# Altium project OFP_MCM_v1.6.3.PrjPcb (part 1 of 7)
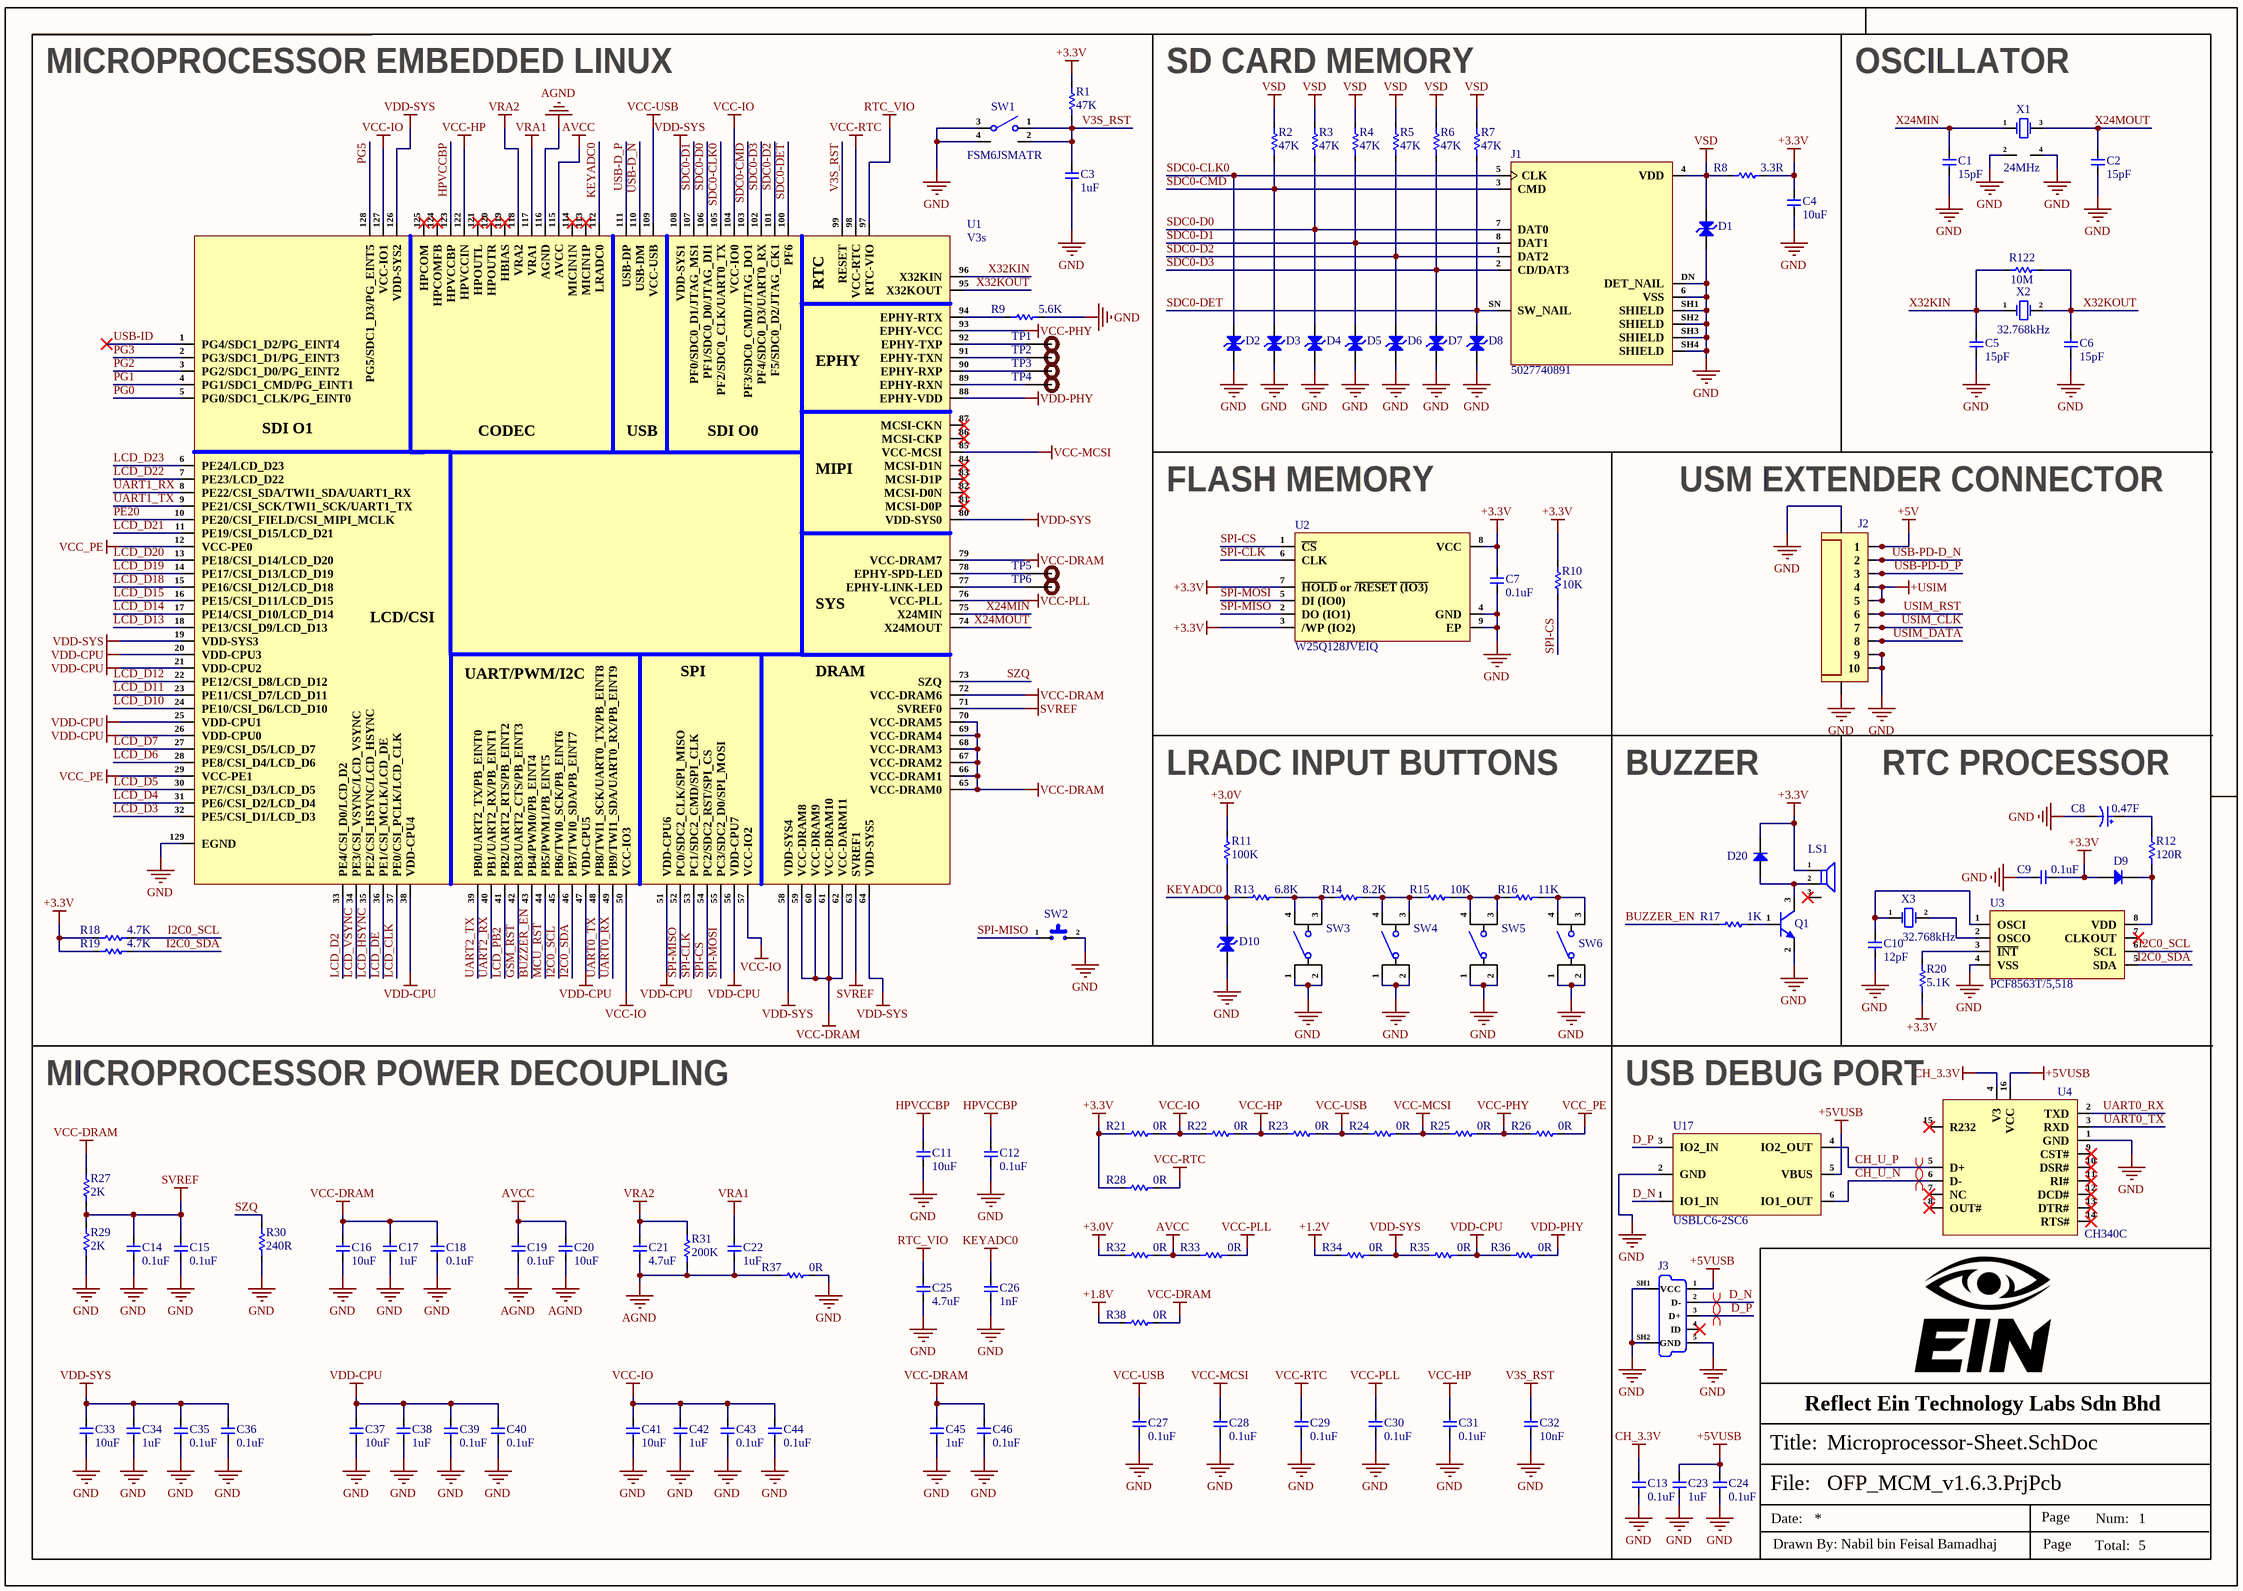
[diagram p0: Microprocessor-Sheet.SchDoc]
5 sheets, 394 parts. Net scope: global (net labels, ports and power ports of the same name join across sheets).
Board file: OFP_MCM_v1.6.3.PcbDoc
Sheets:
  Microprocessor-Sheet.SchDoc
  Power-Sheet.SchDoc
  RGB-LCD-Sheet.SchDoc
  GSM-USB-HUB-Sheet.SchDoc
  Others-Sheet.SchDoc

## Sheet Microprocessor-Sheet.SchDoc
size 420 x 297 mm; SheetNumber: 1; SheetTotal: 5

### Parts
C1  15pF  [Cap-0402]
C2  15pF  [Cap-0402]
C3  1uF  [Cap-0402]
C4  10uF  [Cap-0603]
C5  15pF  [Cap-0402]
C6  15pF  [Cap-0402]
C7  0.1uF  [Cap-0402]
C8  0.47F  [SC EB 5R5 474 M]
C9  0.1uF  [Cap-0603]
C10  12pF  [Cap-0603]
C11  10uF  [Cap-0603]
C12  0.1uF  [Cap-0402]
C13  0.1uF  [Cap-0402]
C14  0.1uF  [Cap-0402]
C15  0.1uF  [Cap-0402]
C16  10uF  [Cap-0603]
C17  1uF  [Cap-0402]
C18  0.1uF  [Cap-0402]
C19  0.1uF  [Cap-0402]
C20  10uF  [Cap-0603]
C21  4.7uF  [Cap-0402]
C22  1uF  [Cap-0402]
C23  1uF  [Cap-0402]
C24  0.1uF  [Cap-0402]
C25  4.7uF  [Cap-0402]
C26  1nF  [Cap-0402]
C27  0.1uF  [Cap-0402]
C28  0.1uF  [Cap-0402]
C29  0.1uF  [Cap-0402]
C30  0.1uF  [Cap-0402]
C31  0.1uF  [Cap-0402]
C32  10nF  [Cap-0402]
C33  10uF  [Cap-0603]
C34  1uF  [Cap-0402]
C35  0.1uF  [Cap-0402]
C36  0.1uF  [Cap-0402]
C37  10uF  [Cap-0603]
C38  1uF  [Cap-0402]
C39  0.1uF  [Cap-0402]
C40  0.1uF  [Cap-0402]
C41  10uF  [Cap-0603]
C42  1uF  [Cap-0402]
C43  0.1uF  [Cap-0402]
C44  0.1uF  [Cap-0402]
C45  1uF  [Cap-0402]
C46  0.1uF  [Cap-0402]
D1  ESD5Z3.3C  [SOD-523 (Bi-Directional)]  (value not drawn)
D2  ESD5Z3.3C  [SOD-523 (Bi-Directional)]  (value not drawn)
D3  ESD5Z3.3C  [SOD-523 (Bi-Directional)]  (value not drawn)
D4  ESD5Z3.3C  [SOD-523 (Bi-Directional)]  (value not drawn)
D5  ESD5Z3.3C  [SOD-523 (Bi-Directional)]  (value not drawn)
D6  ESD5Z3.3C  [SOD-523 (Bi-Directional)]  (value not drawn)
D7  ESD5Z3.3C  [SOD-523 (Bi-Directional)]  (value not drawn)
D8  ESD5Z3.3C  [SOD-523 (Bi-Directional)]  (value not drawn)
D9  1N4148WT  [SOD-523F]  (value not drawn)
D10  ESD5Z3.3C  [SOD-523 (Bi-Directional)]  (value not drawn)
D20  1N4148WT  [SOD-523F]  (value not drawn)
J1  5027740891  [5027740891]
J2  HX0.5-10P XJH2.0 043  [HX0.5-10P XJH2.0 043]  (value not drawn)
J3  U-D-M5DD-Y-3  [U-D-M5DD-Y-3]  (value not drawn)
LS1  FUET-5025  [FUET-5025]  (value not drawn)
Q1  MMBT2222A-7-F  [SOT-23]  (value not drawn)
R1  47K  [Res-0402]
R2  47K  [Res-0402]
R3  47K  [Res-0402]
R4  47K  [Res-0402]
R5  47K  [Res-0402]
R6  47K  [Res-0402]
R7  47K  [Res-0402]
R8  3.3R  [Res-0402]
R9  5.6K  [Res-0402]
R10  10K  [Res-0402]
R11  100K  [Res-0402]
R12  120R  [Res-0603]
R13  6.8K  [Res-0402]
R14  8.2K  [Res-0402]
R15  10K  [Res-0402]
R16  11K  [Res-0402]
R17  1K  [Res-0402]
R18  4.7K  [Res-0402]
R19  4.7K  [Res-0402]
R20  5.1K  [Res-0603]
R21  0R  [Res-0402]
R22  0R  [Res-0402]
R23  0R  [Res-0402]
R24  0R  [Res-0402]
R25  0R  [Res-0402]
R26  0R  [Res-0402]
R27  2K  [Res-0402]
R28  0R  [Res-0402]
R29  2K  [Res-0402]
R30  240R  [Res-0402]
R31  200K  [Res-0402]
R32  0R  [Res-0402]
R33  0R  [Res-0402]
R34  0R  [Res-0402]
R35  0R  [Res-0402]
R36  0R  [Res-0402]
R37  0R  [Res-0402]
R38  0R  [Res-0402]
R122  10M  [Res-0402]
SW1  FSM6JSMATR  [FSM6JSMATR]
SW2  TS-1088-AR02016  [TS-1088-AR02016]  (value not drawn)
SW3  TS-1002S-12026C  [TS-1002S-12026C]  (value not drawn)
SW4  TS-1002S-12026C  [TS-1002S-12026C]  (value not drawn)
SW5  TS-1002S-12026C  [TS-1002S-12026C]  (value not drawn)
SW6  TS-1002S-12026C  [TS-1002S-12026C]  (value not drawn)
TP1  TEST POINT 0.5mm Dia  [Test-point - 0.5mm]  (value not drawn)  (no BOM)
TP2  TEST POINT 0.5mm Dia  [Test-point - 0.5mm]  (value not drawn)  (no BOM)
TP3  TEST POINT 0.5mm Dia  [Test-point - 0.5mm]  (value not drawn)  (no BOM)
TP4  TEST POINT 0.5mm Dia  [Test-point - 0.5mm]  (value not drawn)  (no BOM)
TP5  TEST POINT 0.5mm Dia  [Test-point - 0.5mm]  (value not drawn)  (no BOM)
TP6  TEST POINT 0.5mm Dia  [Test-point - 0.5mm]  (value not drawn)  (no BOM)
U1  V3s  [LQFP-128-EP(14x14)]
U2  W25Q128JVEIQ  [WSON-8-EP(6x8)]
U3  PCF8563T/5,518  [SOIC-8(0.154", 3.90mm Width)]
U4  CH340C  [SOP-16]
U17  USBLC6-2SC6  [SOT-23-6]
X1  24MHz  [SMD3225-4P]
X2  32.768kHz  [SMD3215-2P]
X3  32.768kHz  [SMD3215-2P]

### Nets
+1.2V: R34.1
+1.8V: R38.1
+3.0V: R11.2 R32.1
+3.3V: C4.2 C7.2 C9.2 D9.1(A) D20.2(K) LS1.1(+) R1.2 R8.2 R10.2 R18.1 R19.1 R20.1 R21.1 R28.1 U2.3(/WP_(IO2)) U2.7(~{HOLD}_or_~{/RESET}_~{(IO3)}) U2.8(VCC)
+5V: J2.1
+5VUSB: C23.2 C24.2 J3.1(VCC) U4.16(VCC) U17.5(VBUS)
+USIM: J2.4 J2.5
AGND: C19.1 C20.1 C21.1 C22.1 R31.1 R37.1 U1.116(AGND)
AVCC: C19.2 C20.2 R32.2 R33.1 U1.115(AVCC)
CH_3.3V: C13.2 U4.4(V3)
GND: C1.1 C2.1 C3.1 C4.1 C5.1 C6.1 C7.1 C8.2 C9.1 C10.1 C11.1 C12.1 C13.1 C14.1 C15.1 C16.1 C17.1 C18.1 C23.1 C24.1 C25.1 C26.1 C27.1 C28.1 C29.1 C30.1 C31.1 C32.1 C33.1 C34.1 C35.1 C36.1 C37.1 C38.1 C39.1 C40.1 C41.1 C42.1 C43.1 C44.1 C45.1 C46.1 D1.1(A) D2.1(A) D3.1(A) D4.1(A) D5.1(A) D6.1(A) D7.1(A) D8.1(A) D10.1(A) J1.6(VSS) J1.DN(DET_NAIL) J1.SH1(SHIELD) J1.SH2(SHIELD) J1.SH3(SHIELD) J1.SH4(SHIELD) J2.9 J2.10 J2.MP1 J2.MP2 J3.5(GND) J3.SH1(Sheild) J3.SH2(Sheild) Q1.2(E) R9.2 R29.1 R30.1 R37.2 SW1.3 SW1.4 SW2.2 SW3.1 SW3.2 SW4.1 SW4.2 SW5.1 SW5.2 SW6.1 SW6.2 U1.129(EGND) U2.4(GND) U2.9(EP) U3.4(VSS) U4.1(GND) U17.2(GND) X1.2(GND) X1.4(GND)
HPVCCBP: C11.2 C12.2 U1.123(HPVCCBP)
KEYADC0: C26.2 D10.2(A) R11.1 R13.1 U1.112(LRADC0)
RTC_VIO: C25.2 U1.97(RTC-VIO)
SVREF: C14.2 C15.2 R27.1 R29.2 U1.63(SVREF1) U1.71(SVREF0)
V3S_RST: C3.2 C32.2 R1.1 SW1.1 SW1.2 U1.99(RESET)
VCC-DRAM: C16.2 C17.2 C18.2 C45.2 C46.2 R27.2 R38.2 U1.59(VCC-DRAM8) U1.60(VCC-DRAM9) U1.61(VCC-DRAM10) U1.62(VCC-DARM11) U1.65(VCC-DRAM0) U1.66(VCC-DRAM1) U1.67(VCC-DRAM2) U1.68(VCC-DRAM3) U1.69(VCC-DRAM4) U1.70(VCC-DRAM5) U1.72(VCC-DRAM6) U1.79(VCC-DRAM7)
VCC-HP: C31.2 R22.2 R23.1 U1.122(HPVCCIN)
VCC-IO: C41.2 C42.2 C43.2 C44.2 R21.2 R22.1 U1.50(VCC-IO3) U1.57(VCC-IO2) U1.104(VCC-IO0) U1.127(VCC-IO1)
VCC-MCSI: C28.2 R24.2 R25.1 U1.85(VCC-MCSI)
VCC-PHY: R25.2 R26.1 U1.93(EPHY-VCC)
VCC-PLL: C30.2 R33.2 U1.76(VCC-PLL)
VCC-RTC: C29.2 R28.2 U1.98(VCC-RTC)
VCC-USB: C27.2 R23.2 R24.1 U1.109(VCC-USB)
VCC_PE: R26.2 U1.12(VCC-PE0) U1.29(VCC-PE1)
VDD-CPU: C37.2 C38.2 C39.2 C40.2 R35.2 R36.1 U1.20(VDD-CPU3) U1.21(VDD-CPU2) U1.25(VDD-CPU1) U1.26(VDD-CPU0) U1.38(VDD-CPU4) U1.47(VDD-CPU5) U1.51(VDD-CPU6) U1.56(VDD-CPU7)
VDD-PHY: R36.2 U1.88(EPHY-VDD)
VDD-SYS: C33.2 C34.2 C35.2 C36.2 R34.2 R35.1 U1.19(VDD-SYS3) U1.58(VDD-SYS4) U1.64(VDD-SYS5) U1.80(VDD-SYS0) U1.108(VDD-SYS1) U1.126(VDD-SYS2)
VRA1: C22.2 U1.117(VRA1)
VRA2: C21.2 R31.2 U1.118(VRA2)
VSD: D1.2(A) J1.4(VDD) R2.2 R3.2 R4.2 R5.2 R6.2 R7.2 R8.1
BUZZER_EN: R17.1 U1.43(PB4/PWM0/PB_EINT4)
CH_U_N: U4.6(D-) U17.6(IO1_OUT)
CH_U_P: U4.5(D+) U17.4(IO2_OUT)
D_N: J3.2(D-) U17.1(IO1_IN)
D_P: J3.3(D+) U17.3(IO2_IN)
GSM_RST: U1.42(PB3/UART2_CTS/PB_EINT3)
I2C0_SCL: R18.2 U1.45(PB6/TWI0_SCK/PB_EINT6) U3.6(SCL)
I2C0_SDA: R19.2 U1.46(PB7/TWI0_SDA/PB_EINT7) U3.5(SDA)
LCD_CLK: U1.37(PE0/CSI_PCLK/LCD_CLK)
LCD_D2: U1.33(PE4/CSI_D0/LCD_D2)
LCD_D3: U1.32(PE5/CSI_D1/LCD_D3)
LCD_D4: U1.31(PE6/CSI_D2/LCD_D4)
LCD_D5: U1.30(PE7/CSI_D3/LCD_D5)
LCD_D6: U1.28(PE8/CSI_D4/LCD_D6)
LCD_D7: U1.27(PE9/CSI_D5/LCD_D7)
LCD_D10: U1.24(PE10/CSI_D6/LCD_D10)
LCD_D11: U1.23(PE11/CSI_D7/LCD_D11)
LCD_D12: U1.22(PE12/CSI_D8/LCD_D12)
LCD_D13: U1.18(PE13/CSI_D9/LCD_D13)
LCD_D14: U1.17(PE14/CSI_D10/LCD_D14)
LCD_D15: U1.16(PE15/CSI_D11/LCD_D15)
LCD_D18: U1.15(PE16/CSI_D12/LCD_D18)
LCD_D19: U1.14(PE17/CSI_D13/LCD_D19)
LCD_D20: U1.13(PE18/CSI_D14/LCD_D20)
LCD_D21: U1.11(PE19/CSI_D15/LCD_D21)
LCD_D22: U1.7(PE23/LCD_D22)
LCD_D23: U1.6(PE24/LCD_D23)
LCD_DE: U1.36(PE1/CSI_MCLK/LCD_DE)
LCD_HSYNC: U1.35(PE2/CSI_HSYNC/LCD_HSYNC)
LCD_PB2: U1.41(PB2/UART2_RTS/PB_EINT2)
LCD_VSYNC: U1.34(PE3/CSI_VSYNC/LCD_VSYNC)
MCU_RST: U1.44(PB5/PWM1/PB_EINT5)
PE20: U1.10(PE20/CSI_FIELD/CSI_MIPI_MCLK)
PG0: U1.5(PG0/SDC1_CLK/PG_EINT0)
PG1: U1.4(PG1/SDC1_CMD/PG_EINT1)
PG2: U1.3(PG2/SDC1_D0/PG_EINT2)
PG3: U1.2(PG3/SDC1_D1/PG_EINT3)
PG5: U1.128(PG5/SDC1_D3/PG_EINT5)
SDC0-CLK0: D2.2(A) J1.5(CLK) U1.105(PF2/SDC0_CLK/UART0_TX)
SDC0-CMD: D3.2(A) J1.3(CMD) R2.1 U1.103(PF3/SDC0_CMD/JTAG_DO1)
SDC0-D0: D4.2(A) J1.7(DAT0) R3.1 U1.106(PF1/SDC0_D0/JTAG_DI1)
SDC0-D1: D5.2(A) J1.8(DAT1) R4.1 U1.107(PF0/SDC0_D1/JTAG_MS1)
SDC0-D2: D6.2(A) J1.1(DAT2) R5.1 U1.101(F5/SDC0_D2/JTAG_CK1)
SDC0-D3: D7.2(A) J1.2(CD/DAT3) R6.1 U1.102(PF4/SDC0_D3/UART0_RX)
SDC0-DET: D8.2(A) J1.SN(SW_NAIL) R7.1 U1.100(PF6)
SPI-CLK: U1.53(PC1/SDC2_CMD/SPI_CLK) U2.6(CLK)
SPI-CS: R10.1 U1.54(PC2/SDC2_RST/SPI_CS) U2.1(~{CS})
SPI-MISO: SW2.1 U1.52(PC0/SDC2_CLK/SPI_MISO) U2.2(DO_(IO1))
SPI-MOSI: U1.55(PC3/SDC2_D0/SPI_MOSI) U2.5(DI_(IO0))
SZQ: R30.2 U1.73(SZQ)
UART0_RX: U1.49(PB9/TWI1_SDA/UART0_RX/PB_EINT9) U4.2(TXD)
UART0_TX: U1.48(PB8/TWI1_SCK/UART0_TX/PB_EINT8) U4.3(RXD)
UART1_RX: U1.8(PE22/CSI_SDA/TWI1_SDA/UART1_RX)
UART1_TX: U1.9(PE21/CSI_SCK/TWI1_SCK/UART1_TX)
UART2_RX: U1.40(PB1/UART2_RX/PB_EINT1)
UART2_TX: U1.39(PB0/UART2_TX/PB_EINT0)
USB-D_N: U1.110(USB-DM)
USB-D_P: U1.111(USB-DP)
USB-ID: U1.1(PG4/SDC1_D2/PG_EINT4)
USB-PD-D_N: J2.2
USB-PD-D_P: J2.3
USIM_CLK: J2.7
USIM_DATA: J2.8
USIM_RST: J2.6
X24MIN: C1.2 U1.75(X24MIN) X1.1(OSC1)
X24MOUT: C2.2 U1.74(X24MOUT) X1.3(OSC2)
X32KIN: C5.2 R122.1 U1.96(X32KIN) X2.1(OSC1)
X32KOUT: C6.2 R122.2 U1.95(X32KOUT) X2.2(OSC2)
NetC8_1: C8.1 R12.2
NetC10_2: C10.2 U3.1(OSCI) X3.1(OSC1)
NetD9_2: D9.2(K) R12.1 U3.8(VDD)
NetD20_1: D20.1(A) LS1.2(-) Q1.3(C)
NetQ1_1: Q1.1(B) R17.2
NetR9_1: R9.1 U1.94(EPHY-RTX)
NetR13_2: R13.2 R14.1 SW3.3 SW3.4
NetR14_2: R14.2 R15.1 SW4.3 SW4.4
NetR15_2: R15.2 R16.2 SW5.3 SW5.4
NetR16_1: R16.1 SW6.3 SW6.4
NetR20_2: R20.2 U3.3(~{INT})
NetTP1_1: TP1.1 U1.92(EPHY-TXP)
NetTP2_1: TP2.1 U1.91(EPHY-TXN)
NetTP3_1: TP3.1 U1.90(EPHY-RXP)
NetTP4_1: TP4.1 U1.89(EPHY-RXN)
NetTP5_1: TP5.1 U1.78(EPHY-SPD-LED)
NetTP6_1: TP6.1 U1.77(EPHY-LINK-LED)
NetU3_2: U3.2(OSCO) X3.2(OSC2)

Not connected (* = marked no-connect by the designer): J3 4(ID)*; LS1 3*; U1 81(MCSI-D0P)* 82(MCSI-D0N)* 83(MCSI-D1P)* 84(MCSI-D1N)* 86(MCSI-CKP)* 87(MCSI-CKN)* 113(MICIN1P)* 114(MICIN1N)* 119(HBIAS)* 120(HPOUTR)* 121(HPOUTL)* 124(HPCOMFB)* 125(HPCOM)*; U3 7(CLKOUT)*; U4 7(NC)* 8(OUT#)* 9(CST#)* 10(DSR#)* 11(RI#)* 12(DCD#)* 13(DTR#)* 14(RTS#)* 15(R232)*

### Layout directives
differential pair; differential pair class DIFF_USB: D_N, D_P
differential pair: CH_U_N, CH_U_P

### Notes on the sheet
- MICROPROCESSOR EMBEDDED LINUX
- SD CARD MEMORY
- (near X1) OSCILLATOR
- (near U2) FLASH MEMORY
- (near J2) USM EXTENDER CONNECTOR
- LRADC INPUT BUTTONS
- BUZZER
- (near C8) RTC PROCESSOR
- MICROPROCESSOR POWER DECOUPLING
- USB DEBUG PORT
- Reflect Ein Technology Labs Sdn Bhd
- File:
- Title:
- Date:
- Page
- Num:
- Total:
- Drawn By: Nabil bin Feisal Bamadhaj
- (in symbol V3s) RTC; EPHY; SDI O1; CODEC; USB; SDI O0; MIPI; SYS; LCD/CSI; UART/PWM/I2C; SPI; DRAM